# Altium schematic sheet AD9361_RF.SchDoc
size A4; SheetNumber: 8; SheetTotal: 11
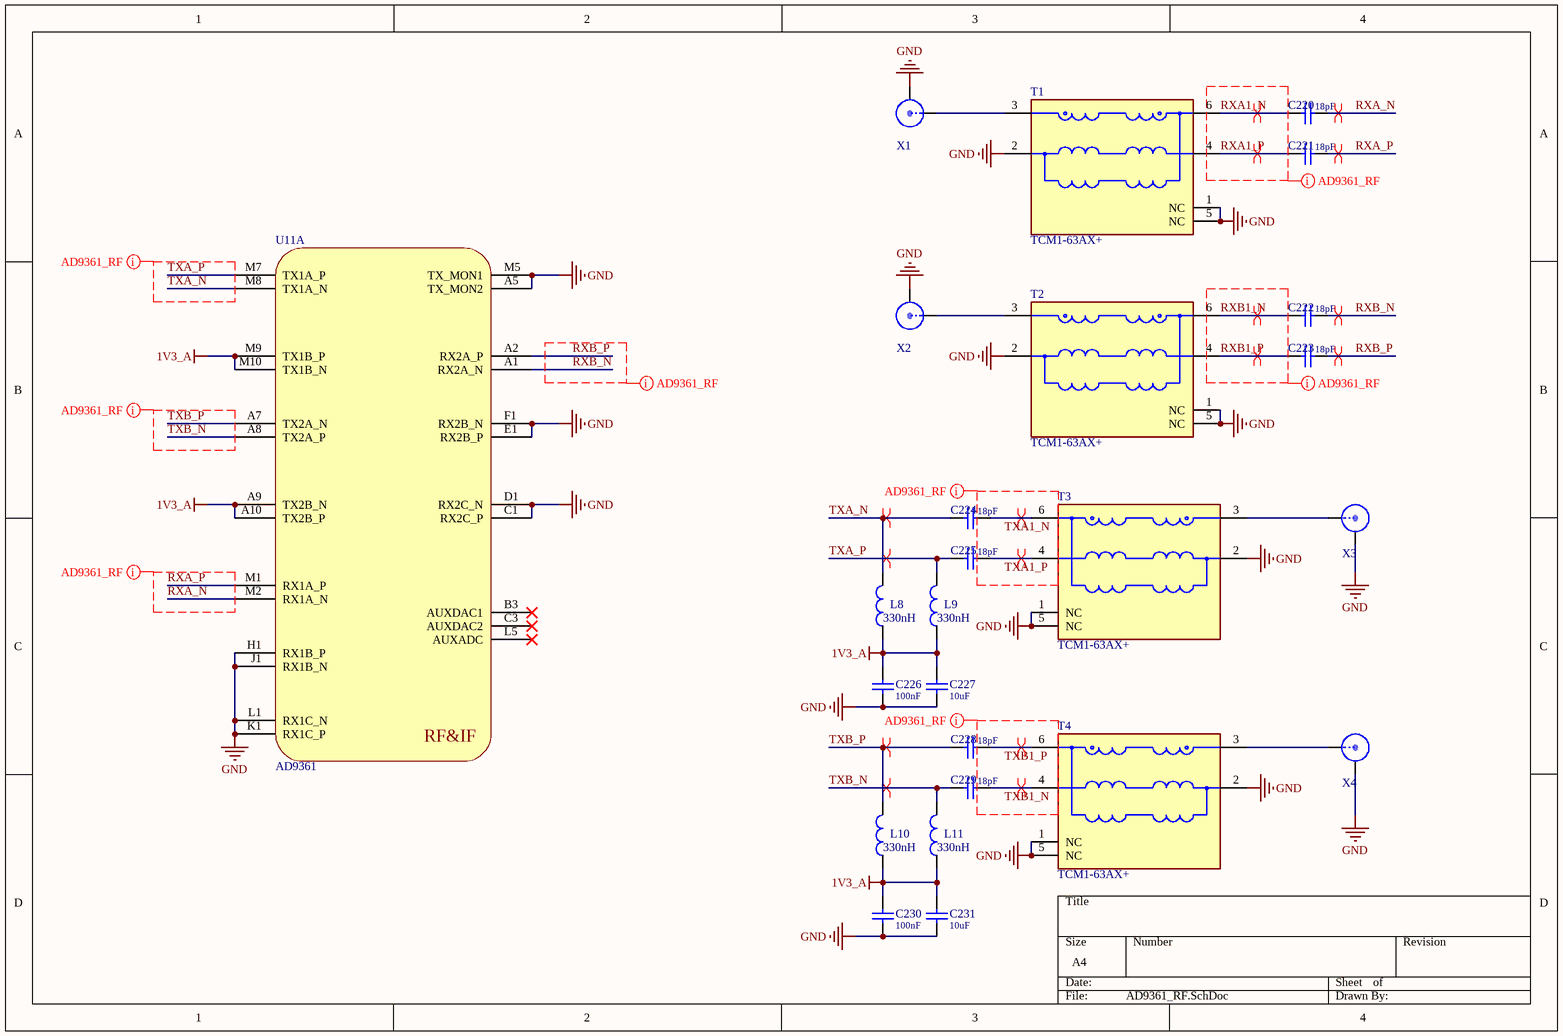
[diagram p0: AD9361_RF.SchDoc]

## Parts
C220  value 18pF  [C0201]  (hidden comment: Cap-S)
C221  value 18pF  [C0201]  (hidden comment: Cap-S)
C222  value 18pF  [C0201]  (hidden comment: Cap-S)
C223  value 18pF  [C0201]  (hidden comment: Cap-S)
C224  value 18pF  [C0201]  (hidden comment: Cap-S)
C225  value 18pF  [C0201]  (hidden comment: Cap-S)
C226  value 100nF  [C0603-L]  (hidden comment: Cap-S)
C227  value 10uF  [C0603-L]  (hidden comment: Cap-S)
C228  value 18pF  [C0201]  (hidden comment: Cap-S)
C229  value 18pF  [C0201]  (hidden comment: Cap-S)
C230  value 100nF  [C0603-L]  (hidden comment: Cap-S)
C231  value 10uF  [C0603-L]  (hidden comment: Cap-S)
L8  330nH  [L0603]
L9  330nH  [L0603]
L10  330nH  [L0603]
L11  330nH  [L0603]
T1  TCM1-63AX+  [FP-TCM1-63AX+-MFG]
T2  TCM1-63AX+  [FP-TCM1-63AX+-MFG]
T3  TCM1-63AX+  [FP-TCM1-63AX+-MFG]
T4  TCM1-63AX+  [FP-TCM1-63AX+-MFG]
U11  AD9361  [BGA144C80P12X12_1000X1000X170]  (part A of 3)
X1  SMA  [SMA_ANGLE]  (value not drawn)
X2  SMA  [SMA_ANGLE]  (value not drawn)
X3  SMA  [SMA_ANGLE]  (value not drawn)
X4  SMA  [SMA_ANGLE]  (value not drawn)

## Nets
1V3_A: C226.1 C227.1 C230.1 C231.1 L8.1 L9.1 L10.1 L11.1 U11.A9(TX2B_N) U11.A10(TX2B_P) U11.M9(TX1B_P) U11.M10(TX1B_N)
GND: C226.2 C227.2 C230.2 C231.2 T1.1(NC) T1.2(GND) T1.5(NC) T2.1(NC) T2.2(GND) T2.5(NC) T3.1(NC) T3.2(GND) T3.5(NC) T4.1(NC) T4.2(GND) T4.5(NC) U11.A5(TX_MON2) U11.C1(RX2C_P) U11.D1(RX2C_N) U11.E1(RX2B_P) U11.F1(RX2B_N) U11.H1(RX1B_P) U11.J1(RX1B_N) U11.K1(RX1C_P) U11.L1(RX1C_N) U11.M5(TX_MON1) X1.2 X2.2 X3.2 X4.2
RXA1_N: C220.2 T1.6(SECONDARY_DOT)
RXA1_P: C221.2 T1.4(SECONDARY)
RXA_N: C220.1 U11.M2(RX1A_N)
RXA_P: C221.1 U11.M1(RX1A_P)
RXB1_N: C222.2 T2.6(SECONDARY_DOT)
RXB1_P: C223.2 T2.4(SECONDARY)
RXB_N: C222.1 U11.A1(RX2A_N)
RXB_P: C223.1 U11.A2(RX2A_P)
TXA1_N: C224.1 T3.6(SECONDARY_DOT)
TXA1_P: C225.1 T3.4(SECONDARY)
TXA_N: C224.2 L8.2 U11.M8(TX1A_N)
TXA_P: C225.2 L9.2 U11.M7(TX1A_P)
TXB1_N: C229.1 T4.4(SECONDARY)
TXB1_P: C228.1 T4.6(SECONDARY_DOT)
TXB_N: C229.2 L11.2 U11.A8(TX2A_P)
TXB_P: C228.2 L10.2 U11.A7(TX2A_N)
NetT1_3: T1.3(PRIMARY_DOT) X1.1
NetT2_3: T2.3(PRIMARY_DOT) X2.1
NetT3_3: T3.3(PRIMARY_DOT) X3.1
NetT4_3: T4.3(PRIMARY_DOT) X4.1

Not connected (* = marked no-connect by the designer): U11 B3(AUXDAC1)* C3(AUXDAC2)* L5(AUXADC)*

## Layout directives
differential pair: RXA1_N, RXA1_P, RXA_N, RXA_P, RXB1_N, RXB1_P, RXB_N, RXB_P, TXA1_N, TXA1_P, TXA_N, TXA_P, TXB1_N, TXB1_P, TXB_N, TXB_P
net class AD9361_RF: RXA1_N, RXA1_P, RXA_N, RXA_P, RXB1_N, RXB1_P, RXB_N, RXB_P, TXA1_N, TXA1_P, TXA_N, TXA_P, TXB1_N, TXB1_P, TXB_N, TXB_P

## Notes on the sheet
- (in symbol AD9361, part A) RF&IF

## Library data of the parts
C220-C231 = Cap-S: 贴片瓷片电容
L8-L11 = L
T1-T4 = CMP-199822-000001-1: 1:1 CORE & WIRE Transformer, 10 - 6000 MHz, 50Ω; Manufacturer: Mini-Circuits; Insertion Loss: 1.16-1.8dB; Return Loss: 9.42-16.9dB; Lead Free: Yes; Device Class L3: unset; Temperature: -40°C to +85°C; Manufacturer Part Number: TCM1-63AX+; Frequency: 10-6000MHz; Device Class L2: Transformers; RoHS: TRUE; Octopart: https://octopart.com/tcm1-63ax%2B-mini-circuits-107315723; Temperature Range Low: -40°C; Category: Trans; Package: 0; ComponentLink2URL: https://www.minicircuits.com/pdfs/TCM1-63AX+.pdf; ComponentLink2Description: Datasheet; Automotive: No; Height: 4.06mm; Device Class L1: Passive Components; Temperature Range High: +85°C; Turns Ratio: 1:1
U11 = AD9361: 70M-6G射频收发器
X1-X4 = SMA_1